# Altium schematic sheet RS-485.SchDoc
size A; SheetNumber: 5; SheetTotal: 5
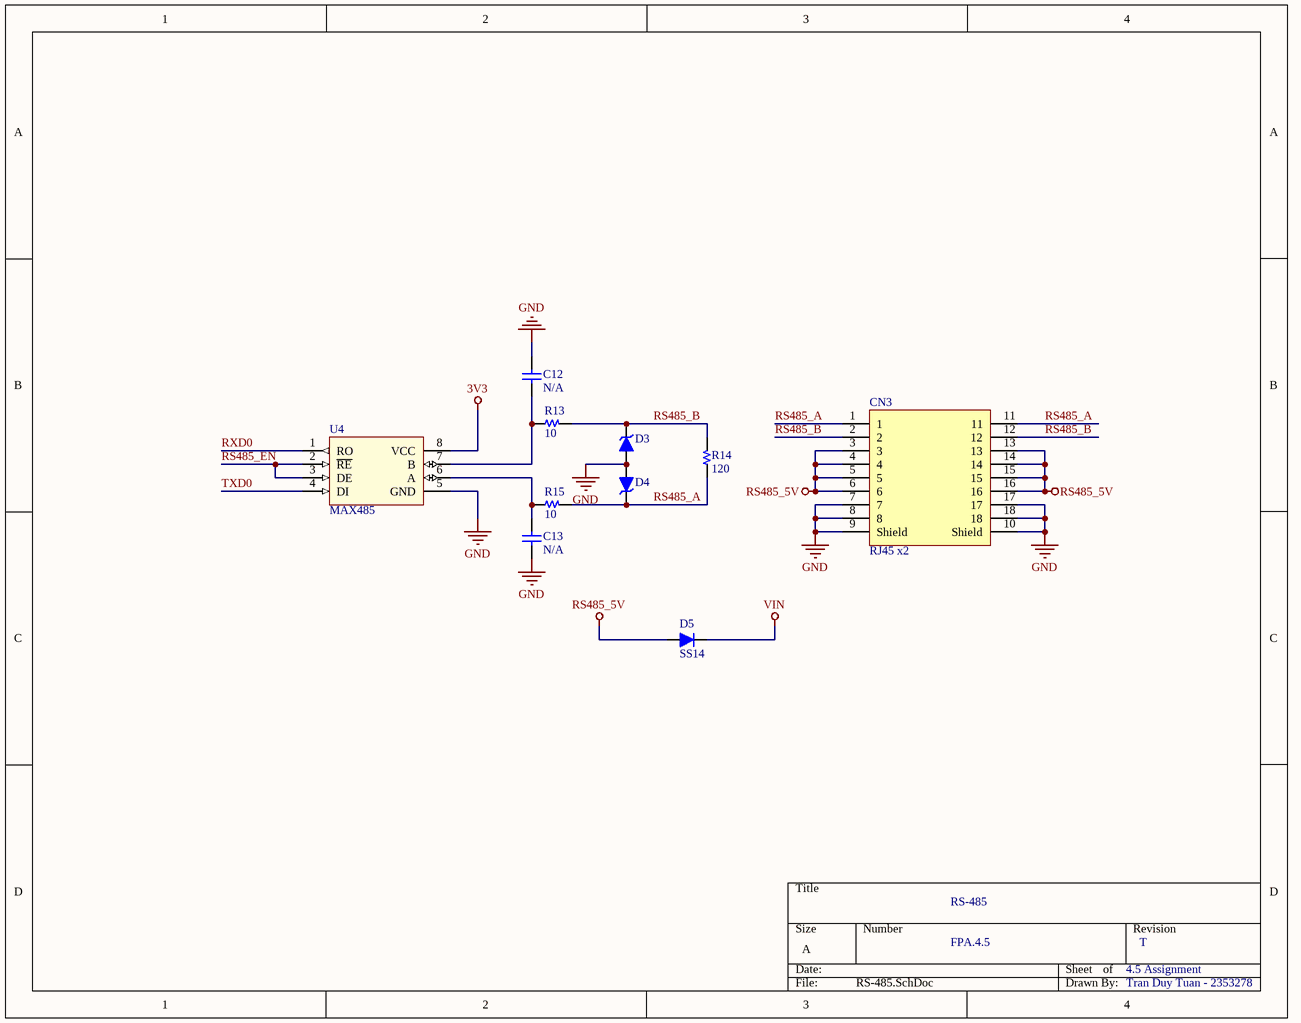
[diagram p0: RS-485.SchDoc]

## Parts
C12  N/A  [C 0805]
C13  N/A  [C 0805]
CN3  RJ45 x2  [CONN/RJ45/x2]
D3  (no value)  [DO-41]
D4  (no value)  [DO-41]
D5  SS14  [DO-41]
R13  10  [R 0805]
R14  120  [R 0805]
R15  10  [R 0805]
U4  MAX485  [SOIC-8]

## Nets
3V3: U4.8(VCC)
GND: C12.1 C13.2 CN3.7 CN3.8 CN3.9(Shield) CN3.10(Shield) CN3.17 CN3.18 D3.1(A) D4.1(A) U4.5(GND)
RS485_5V: CN3.3 CN3.4 CN3.5 CN3.6 CN3.13 CN3.14 CN3.15 CN3.16 D5.1(A)
VIN: D5.2(K)
RS485_A: CN3.1 CN3.11 D4.2(K) R14.1 R15.2
RS485_B: CN3.2 CN3.12 D3.2(K) R13.2 R14.2
RS485_EN: U4.2(~{RE}) U4.3(DE)
RXD0: U4.1(RO)
TXD0: U4.4(DI)
NetC12_2: C12.2 R13.1 U4.7(B)
NetC13_1: C13.1 R15.1 U4.6(A)

## Notes on the sheet
- RS-485
- FPA.4.5
- 4.5 Assignment
- T
- Tran Duy Tuan - 2353278

## Library data of the parts
C12 C13 = Capacitor NP: Capacitor non-pol
CN3 = CON RJ45 x2: Connector RJ45 X2
D3 D4 = Diode Zener: Zener Diode
D5 = Diode: Default Diode
R13-R15 = Resistor
U4 = MAX485: Low-Power, Slew-Rate-Limited  RS-485/RS-422 Transceivers